# EasyEDA Pro project ProPrj_CraftVia-Core-S-G031-v1-Rev0.epro

# Schematic Core-S-G031-Rev0
Board Name: Board1; Create Date: 2026-09-03; Page Name: P1; Project Name: CraftVia-Core-S-G031-v1-Rev0; Schematic Name: Schematic1; Update Date: 2026-09-03; Company: CraftVia,org; Page Size: A3; Version: V1.0
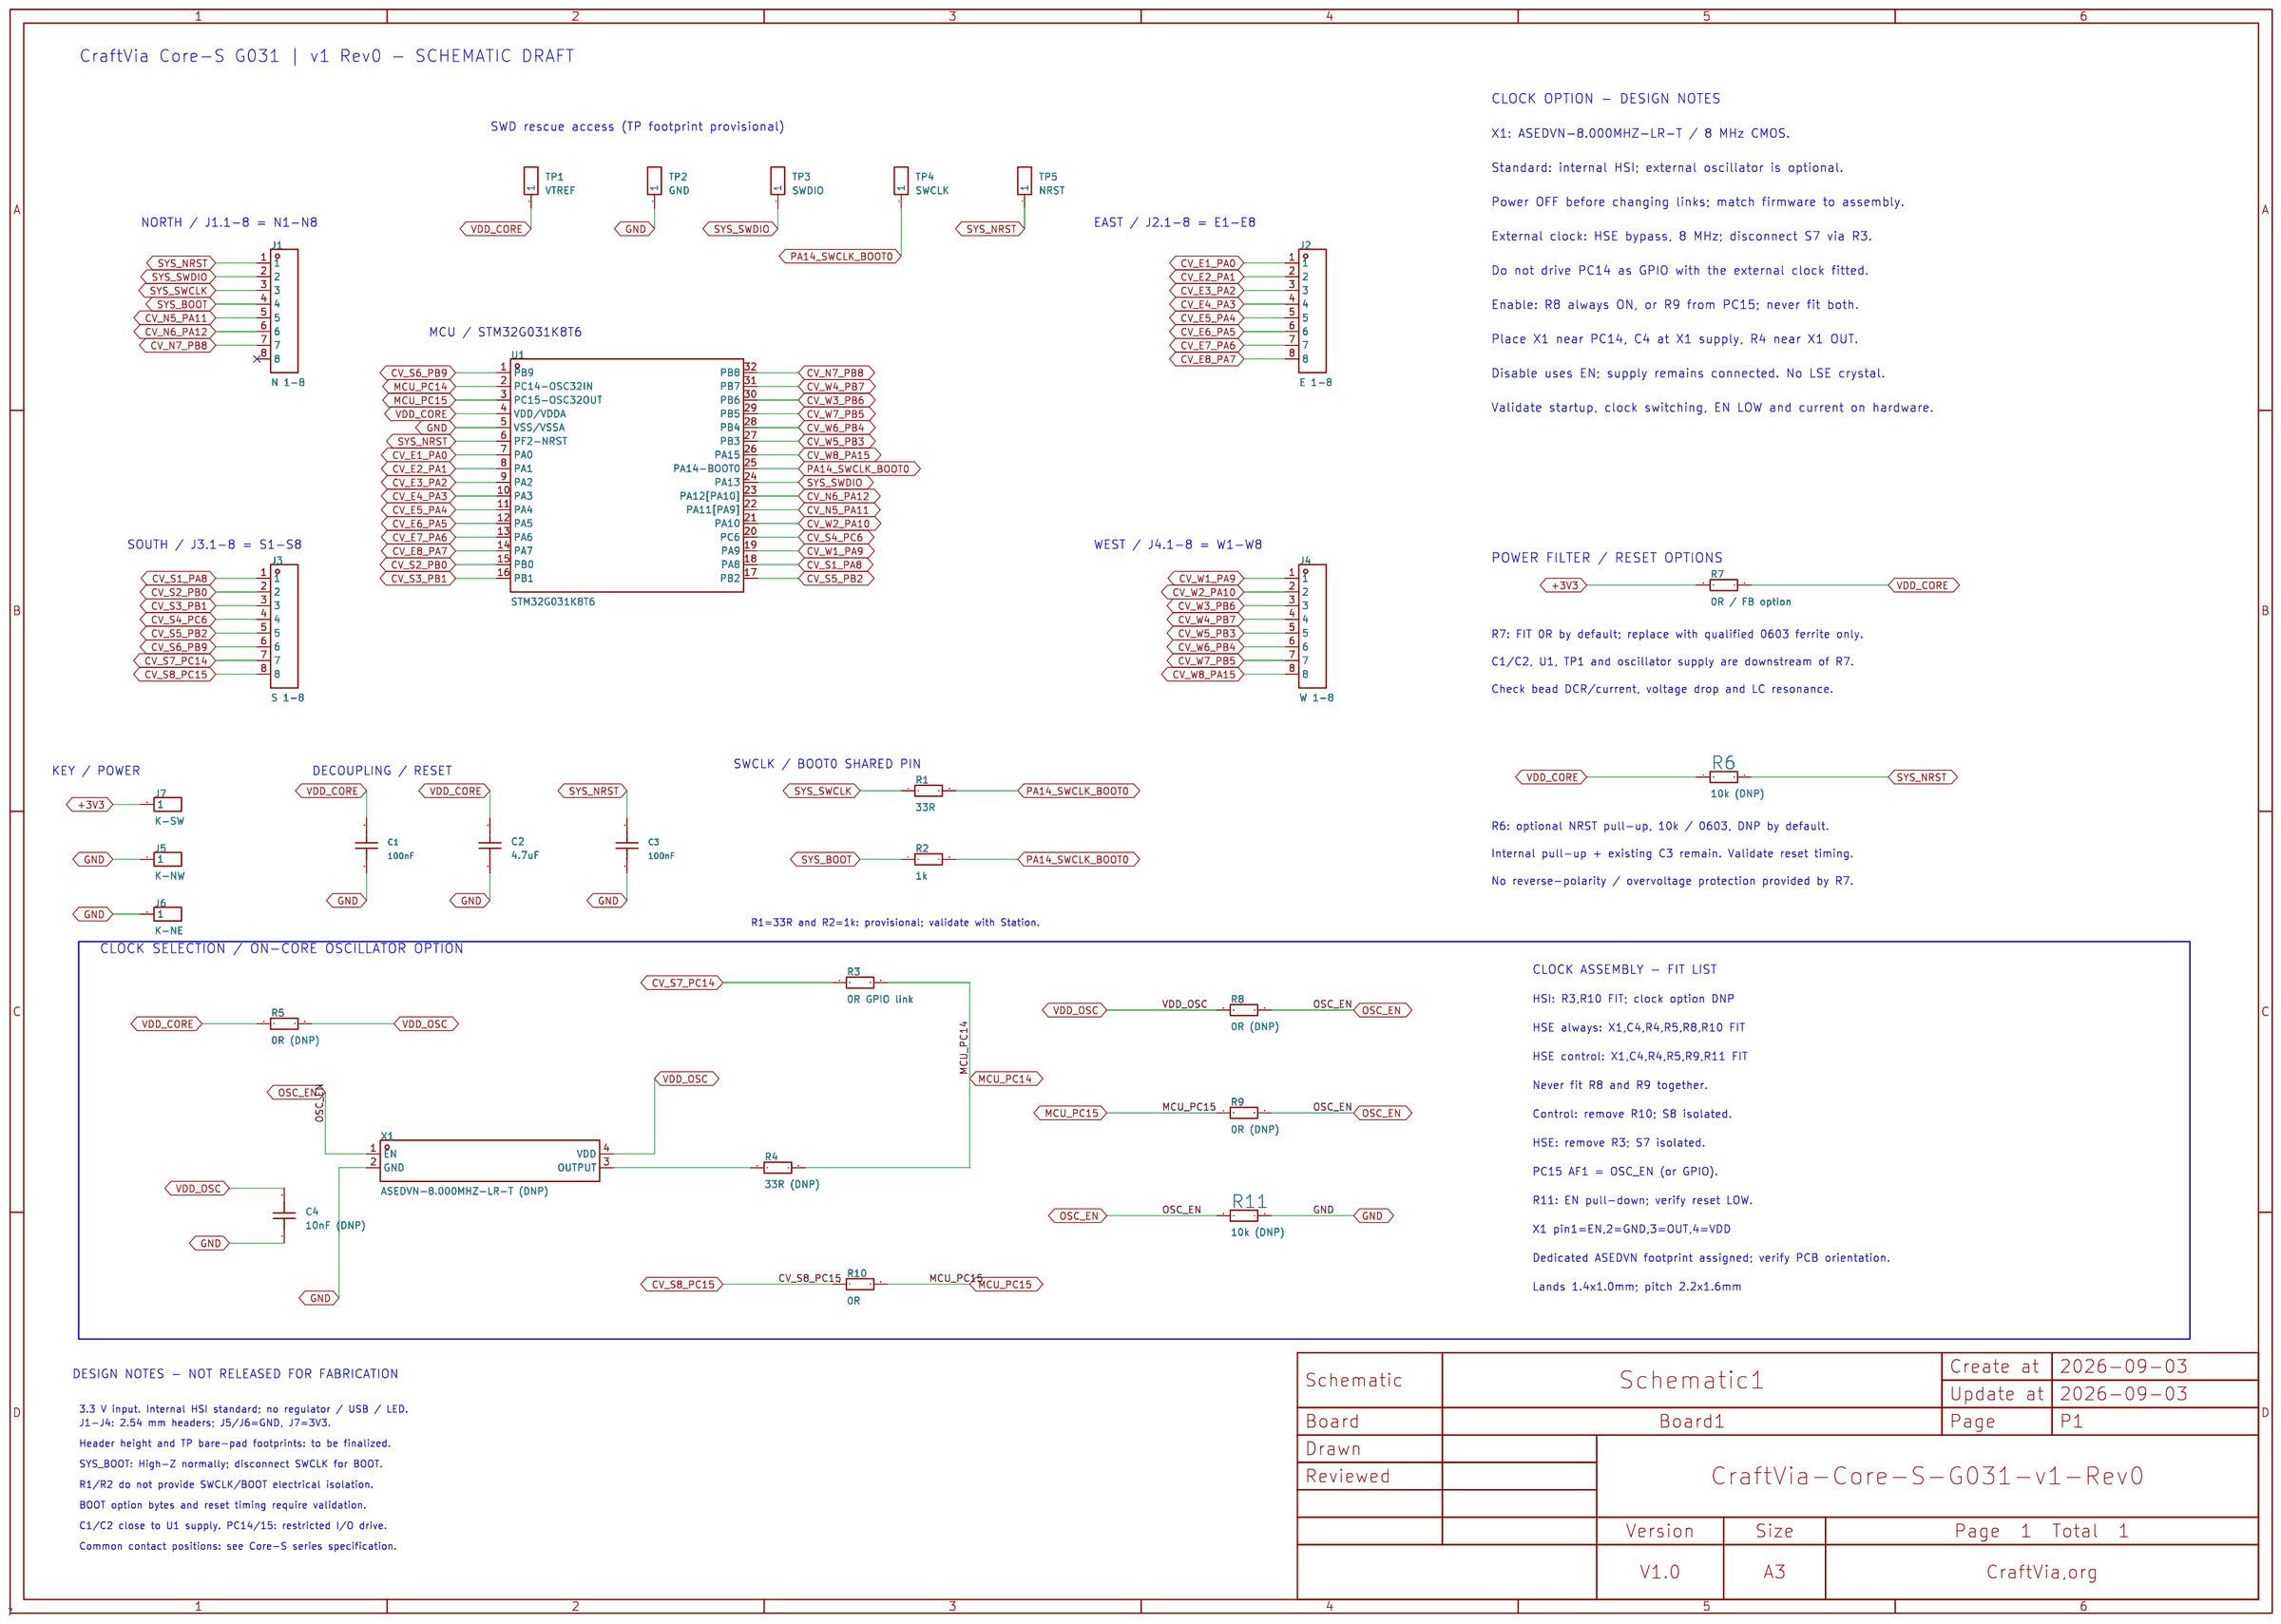
[diagram p0: schematic sheet]

## Parts
C1  100nF  [C0603]
C2  4.7uF  [C0603]
C3  100nF  [C0603]
C4  10nF  [C0603]  (no BOM)
J1  N 1-8  [HDR-TH_8P-P2.54-V-M]
J2  E 1-8  [HDR-TH_8P-P2.54-V-M]
J3  S 1-8  [HDR-TH_8P-P2.54-V-M]
J4  W 1-8  [HDR-TH_8P-P2.54-V-M]
J5  K-NW  [HDR-TH_1P-P2.54-V-M]
J6  K-NE  [HDR-TH_1P-P2.54-V-M]
J7  K-SW  [HDR-TH_1P-P2.54-V-M]
R1  33Ω  [R0603]
R2  1kΩ  [R0603]
R3  0Ω  [R0603]
R4  33Ω  [R0603]  (no BOM)
R5  0Ω  [R0603]  (no BOM)
R6  10kΩ  [R0603]  (no BOM)
R7  0Ω  [R0603]
R8  0Ω  [R0603]  (no BOM)
R9  0Ω  [R0603]  (no BOM)
R10  0Ω  [R0603]
R11  10kΩ  [R0603]  (no BOM)
TP1  VTREF  [HDR-TH_1P-P2.54-V-M]  (no BOM)
TP2  GND  [HDR-TH_1P-P2.54-V-M]  (no BOM)
TP3  SWDIO  [HDR-TH_1P-P2.54-V-M]  (no BOM)
TP4  SWCLK  [HDR-TH_1P-P2.54-V-M]  (no BOM)
TP5  NRST  [HDR-TH_1P-P2.54-V-M]  (no BOM)
U1  STM32G031K8T6  [LQFP-32_L7.0-W7.0-P0.80-LS9.0-BL]
X1  8MHz  [CraftVia_ASEDVN_3225_4P]  (no BOM)

## Library data of the parts
C1 C3 = CC0603KRX7R9BB104: Capacitance:100nF Tolerance:±10% Tolerance:±10% Voltage Rating:50V Temperature Coefficient:X7R; LCSC Part Name: 100nF ±10% 50V; Supplier Part: C14663; Manufacturer: YAGEO(国巨); Supplier Footprint: 0603; JLCPCB Part Class: Basic Part; Datasheet: https://item.szlcsc.com/datasheet/CC0603KRX7R9BB104/15331.html; Supplier: LCSC; Tolerance: ±10%; Voltage Rating: 50V; Temperature Coefficient: X7R
C2 = CL10A475KO8NNNC: Capacitance:4.7uF Tolerance:±10% Tolerance:±10% Voltage Rating:16V Temperature Coefficient:X5R; LCSC Part Name: 4.7uF ±10% 16V; Supplier Part: C19666; Manufacturer: SAMSUNG(三星); Supplier Footprint: 0603; JLCPCB Part Class: Basic Part; Datasheet: https://item.szlcsc.com/datasheet/CL10A475KO8NNNC/20375.html; Supplier: LCSC; Tolerance: ±10%; Voltage Rating: 16V; Temperature Coefficient: X5R
C4 = 0603B103K500NT: Capacitance:10nF Tolerance:±10% Tolerance:±10% Voltage Rating:50V Temperature Coefficient:X7R; LCSC Part Name: 10nF ±10% 50V; Supplier Part: C57112; Manufacturer: FH(风华); Supplier Footprint: 0603; JLCPCB Part Class: Basic Part; Datasheet: https://item.szlcsc.com/datasheet/0603B103K500NT/58143.html; Supplier: LCSC; Tolerance: ±10%; Voltage Rating: 50V; Temperature Coefficient: X7R
J1-J4 = 直排针2.54mm 1*8P: Circluar Pins/Square Pins:- Current Rating (Max):- Voltage Rating (Max):- Length of Mating Pin:- Insulation Height:- Contact Material:; LCSC Part Name: 直排针 2.54mm 1*8P; Supplier Part: C49256; Supplier Footprint: 插件; JLCPCB Part Class: Extended Part; Supplier: LCSC
J5-J7 TP1-TP5 = 2.54-1*1P针: Pin Structure:1x1P Pitch:- Row Spacing:- Circluar Pins/Square Pins:Pin Header Mounting Type:Through Hole Number of Rows:1 Number of Pins:1P Current Rating:3A Voltage Rating (Max):- Length of Mating Pin:6mm Insulation Height:2.5mm Length of End Connection; LCSC Part Name: 1x1P 方针 直插; Supplier Part: C81276; Manufacturer: BOOMELE(博穆精密); Supplier Footprint: 插件,P=2.54mm; JLCPCB Part Class: Extended Part; Datasheet: https://item.szlcsc.com/datasheet/2.54-1*1P%25E9%2592%2588/82426.html; Supplier: LCSC; Pin Structure: 1x1P; Circluar Pins/Square Pins: Pin Header; Mounting Type: Through Hole; Number of Rows: 1; Number of Pins: 1P; Current Rating: 3A; Length of Mating Pin: 6mm; Insulation Height: 2.5mm; Length of End Connection Pin: 3mm; Contact Material: Brass; Contact Plating: Gold; Operating Temperature: -55℃~+105℃; Color: Black
R1 R4 = 0603WAF330JT5E: Type:Thick Film Resistor Resistance:33Ω Tolerance:±1% Tolerance:±1% Power(Watts):100mW Voltage-Supply(Max):75V Temperature Coefficient:±100ppm/℃ Temperature Coefficient:±100ppm/℃ Operating Temperature:-55℃~+155℃ Operating Temperature:-55℃~+155℃; LCSC Part Name: 33Ω ±1% 100mW 厚膜电阻; Supplier Part: C23140; Manufacturer: UNI-ROYAL(厚声); Supplier Footprint: 0603; JLCPCB Part Class: Basic Part; Datasheet: https://item.szlcsc.com/datasheet/0603WAF330JT5E/23867.html; Supplier: LCSC; Type: Thick Film Resistor; Tolerance: ±1%; Power(Watts): 100mW; Voltage-Supply(Max): 75V; Temperature Coefficient: ±100ppm/℃; Operating Temperature: -55℃~+155℃
R2 = 0603WAF1001T5E: Type:Thick Film Resistor Resistance:1kΩ Tolerance:±1% Tolerance:±1% Power(Watts):100mW Voltage-Supply(Max):75V Temperature Coefficient:±100ppm/℃ Temperature Coefficient:±100ppm/℃ Operating Temperature:-55℃~+155℃ Operating Temperature:-55℃~+155℃; LCSC Part Name: 1kΩ ±1% 100mW 厚膜电阻; Supplier Part: C21190; Manufacturer: UNI-ROYAL(厚声); Supplier Footprint: 0603; JLCPCB Part Class: Basic Part; Datasheet: https://item.szlcsc.com/datasheet/0603WAF1001T5E/21904.html; Supplier: LCSC; Type: Thick Film Resistor; Tolerance: ±1%; Power(Watts): 100mW; Voltage-Supply(Max): 75V; Temperature Coefficient: ±100ppm/℃; Operating Temperature: -55℃~+155℃
R3 R5 R7-R10 = 0603WAF0000T5E: Type:Thick Film Resistor Resistance:0Ω Tolerance:±1% Tolerance:±1% Power(Watts):100mW Voltage-Supply(Max):75V Temperature Coefficient:- Temperature Coefficient:- Operating Temperature:-55℃~+155℃ Operating Temperature:-55℃~+155℃; LCSC Part Name: 厚膜电阻 0Ω ±1%; Supplier Part: C21189; Manufacturer: UNI-ROYAL(厚声); Supplier Footprint: 0603; JLCPCB Part Class: Basic Part; Datasheet: https://item.szlcsc.com/datasheet/0603WAF0000T5E/21903.html; Supplier: LCSC; Type: Thick Film Resistor; Tolerance: ±1%; Power(Watts): 100mW; Voltage-Supply(Max): 75V; Operating Temperature: -55℃~+155℃
R6 R11 = 0603WAF1002T5E: Type:Thick Film Resistor Resistance:10kΩ Tolerance:±1% Tolerance:±1% Power(Watts):100mW Voltage-Supply(Max):75V Temperature Coefficient:±100ppm/℃ Temperature Coefficient:±100ppm/℃ Operating Temperature:-55℃~+155℃ Operating Temperature:-55℃~+155℃; LCSC Part Name: 厚膜电阻 10kΩ ±1% 100mW; Supplier Part: C25804; Manufacturer: UNI-ROYAL(厚声); Supplier Footprint: 0603; JLCPCB Part Class: Basic Part; Datasheet: https://item.szlcsc.com/datasheet/0603WAF1002T5E/26547.html; Supplier: LCSC; Type: Thick Film Resistor; Tolerance: ±1%; Power(Watts): 100mW; Voltage-Supply(Max): 75V; Temperature Coefficient: ±100ppm/℃; Operating Temperature: -55℃~+155℃
U1 = STM32G031K8T6: CPU Core:ARM Cortex-M0+ CPU Maximum Speed:64MHz Core Size:32 Bit Program Storage Size:64KB Program Memory Type:FLASH RAM Size:8KB EEPROM:- Number of I/O:30 ADC (Bit):12bit Oscillator Type:Built-in+External Voltage - Supply:1.7V~3.6V Voltage - Supply:1.7V~; LCSC Part Name: 主流Arm Cortex-M0+ MCU，具有64 KB Flash存储器、8 KB RAM、64 MHz CPU、2x USART、定时器、ADC和通信接口，1.7-3.6V; Supplier Part: C432203; Manufacturer: ST(意法半导体); Supplier Footprint: LQFP-32(7x7); JLCPCB Part Class: Extended Part; Datasheet: https://item.szlcsc.com/datasheet/STM32G031K8T6/428991.html; Supplier: LCSC; CPU Core: ARM Cortex-M0+; CPU Maximum Speed: 64MHz; Core Size: 32 Bit; Program Storage Size: 64KB; Program Memory Type: FLASH; RAM Size: 8KB; Number of I/O: 30; ADC (Bit): 12bit; Oscillator Type: Built-in+External; Voltage - Supply: 1.7V~3.6V; Operating Temperature: -40℃~+85℃
X1 = ASEDVN-8.000MHZ-LR-T: Dedicated ASEDVN recommended land: 1.4x1.0mm; pitch 2.2x1.6mm. 1=EN,2=GND,3=OUT,4=VDD. No 3D model.; Manufacturer: Abracon; Supplier: DigiKey; Supplier Part: 535-ASEDVN-8.000MHZ-LR-TCT-ND; Datasheet: https://abracon.com/datasheets/ASEDVN.pdf; Voltage - Supply: 1.6V to 3.63V; Operating Temperature: -40C to +85C; Frequency Stability: 25ppm

## Nets
+3V3: J7.1 R7.1
GND: C1.1 C2.1 C3.1 C4.1 J5.1 J6.1 R11.2 TP2.1 U1.5(VSS/VSSA) X1.2(GND)
VDD_CORE: C1.2 C2.2 R5.1 R6.1 R7.2 TP1.1 U1.4(VDD/VDDA)
VDD_OSC: C4.2 R5.2 R8.1 X1.4(VDD)
CV_E1_PA0: J2.1 U1.7(PA0)
CV_E2_PA1: J2.2 U1.8(PA1)
CV_E3_PA2: J2.3 U1.9(PA2)
CV_E4_PA3: J2.4 U1.10(PA3)
CV_E5_PA4: J2.5 U1.11(PA4)
CV_E6_PA5: J2.6 U1.12(PA5)
CV_E7_PA6: J2.7 U1.13(PA6)
CV_E8_PA7: J2.8 U1.14(PA7)
CV_N5_PA11: J1.5 U1.22(PA11[PA9])
CV_N6_PA12: J1.6 U1.23(PA12[PA10])
CV_N7_PB8: J1.7 U1.32(PB8)
CV_S1_PA8: J3.1 U1.18(PA8)
CV_S2_PB0: J3.2 U1.15(PB0)
CV_S3_PB1: J3.3 U1.16(PB1)
CV_S4_PC6: J3.4 U1.20(PC6)
CV_S5_PB2: J3.5 U1.17(PB2)
CV_S6_PB9: J3.6 U1.1(PB9)
CV_S7_PC14: J3.7 R3.1
CV_S8_PC15: J3.8 R10.1
CV_W1_PA9: J4.1 U1.19(PA9)
CV_W2_PA10: J4.2 U1.21(PA10)
CV_W3_PB6: J4.3 U1.30(PB6)
CV_W4_PB7: J4.4 U1.31(PB7)
CV_W5_PB3: J4.5 U1.27(PB3)
CV_W6_PB4: J4.6 U1.28(PB4)
CV_W7_PB5: J4.7 U1.29(PB5)
CV_W8_PA15: J4.8 U1.26(PA15)
MCU_PC14: R3.2 R4.2 U1.2(PC14-OSC32IN)
MCU_PC15: R9.1 R10.2 U1.3(PC15-OSC32OUT)
OSC_EN: R8.2 R9.2 R11.1 X1.1(EN)
OSC_OUT: R4.1 X1.3(OUTPUT)
PA14_SWCLK_BOOT0: R1.2 R2.2 TP4.1 U1.25(PA14-BOOT0)
SYS_BOOT: J1.4 R2.1
SYS_NRST: C3.2 J1.1 R6.2 TP5.1 U1.6(PF2-NRST)
SYS_SWCLK: J1.3 R1.1
SYS_SWDIO: J1.2 TP3.1 U1.24(PA13)

Not connected (* = marked no-connect by the designer): J1 8*

## Notes on the sheet
- CraftVia Core-S G031 | v1 Rev0 - SCHEMATIC DRAFT
- CLOCK OPTION - DESIGN NOTES
- SWD rescue access (TP footprint provisional)
- X1: ASEDVN-8.000MHZ-LR-T / 8 MHz CMOS.
- Standard: internal HSI; external oscillator is optional.
- Power OFF before changing links; match firmware to assembly.
- NORTH / J1.1-8 = N1-N8
- EAST / J2.1-8 = E1-E8
- External clock: HSE bypass, 8 MHz; disconnect S7 via R3.
- Do not drive PC14 as GPIO with the external clock fitted.
- Enable: R8 always ON, or R9 from PC15; never fit both.
- MCU / STM32G031K8T6
- Place X1 near PC14, C4 at X1 supply, R4 near X1 OUT.
- Disable uses EN; supply remains connected. No LSE crystal.
- Validate startup, clock switching, EN LOW and current on hardware.
- SOUTH / J3.1-8 = S1-S8
- WEST / J4.1-8 = W1-W8
- POWER FILTER / RESET OPTIONS
- R7: FIT 0R by default; replace with qualified 0603 ferrite only.
- C1/C2, U1, TP1 and oscillator supply are downstream of R7.
- Check bead DCR/current, voltage drop and LC resonance.
- KEY / POWER
- DECOUPLING / RESET
- SWCLK / BOOT0 SHARED PIN
- R6: optional NRST pull-up, 10k / 0603, DNP by default.
- Internal pull-up + existing C3 remain. Validate reset timing.
- No reverse-polarity / overvoltage protection provided by R7.
- R1=33R and R2=1k: provisional; validate with Station.
- CLOCK SELECTION / ON-CORE OSCILLATOR OPTION
- CLOCK ASSEMBLY - FIT LIST
- HSI: R3,R10 FIT; clock option DNP
- HSE always: X1,C4,R4,R5,R8,R10 FIT
- HSE control: X1,C4,R4,R5,R9,R11 FIT
- Never fit R8 and R9 together.
- Control: remove R10; S8 isolated.
- HSE: remove R3; S7 isolated.
- PC15 AF1 = OSC_EN (or GPIO).
- R11: EN pull-down; verify reset LOW.
- X1 pin1=EN,2=GND,3=OUT,4=VDD
- Dedicated ASEDVN footprint assigned; verify PCB orientation.
- Lands 1.4x1.0mm; pitch 2.2x1.6mm
- DESIGN NOTES - NOT RELEASED FOR FABRICATION
- 3.3 V input. Internal HSI standard; no regulator / USB / LED.
- J1-J4: 2.54 mm headers; J5/J6=GND, J7=3V3.
- Header height and TP bare-pad footprints: to be finalized.
- SYS_BOOT: High-Z normally; disconnect SWCLK for BOOT.
- R1/R2 do not provide SWCLK/BOOT electrical isolation.
- BOOT option bytes and reset timing require validation.
- C1/C2 close to U1 supply. PC14/15: restricted I/O drive.
- Common contact positions: see Core-S series specification.

# Board PCB1
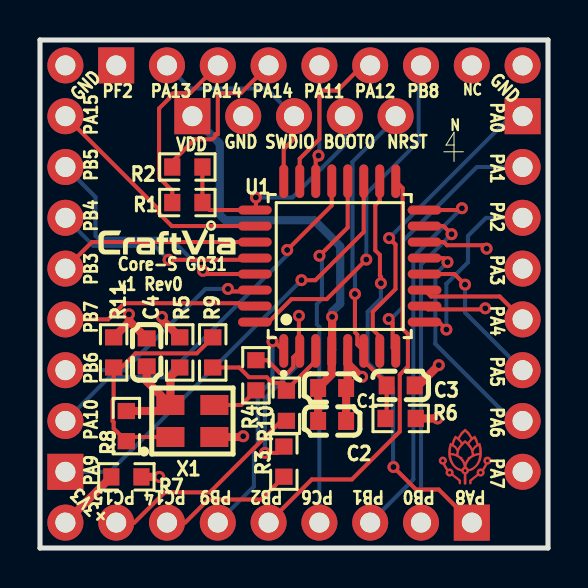
[diagram p1: board, top side]
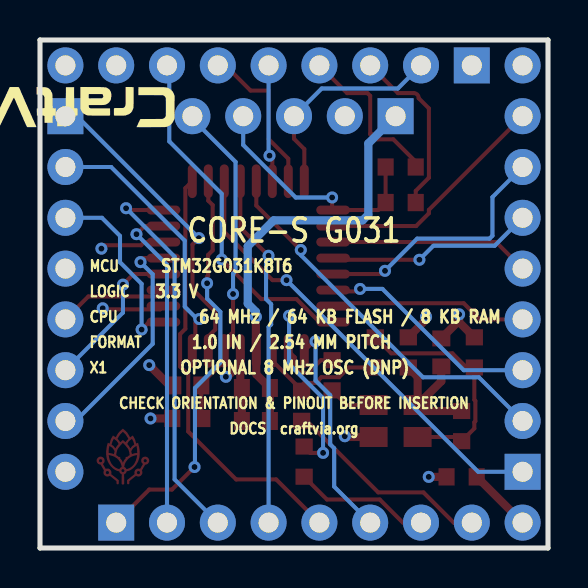
[diagram p2: board, bottom side, seen from below]

Outline 25.4 x 25.4 mm; copper layers: Top Layer, GND Plane, Power / Signal, Bottom Layer. Coordinates in mm from the lower left corner of the outline.
Outline path: 0,25.4 0,0 25.4,0 25.4,25.4 0,25.4
Stack: Top Layer 0.035mm Outer layer thickness 1oz / Dielectric1 0.2104mm 7628 RC49% 8.6mil / GND Plane 0.035mm / Dielectric2 1.065mm 1.1mm H/HOZ Copper / Power / Signal 0.035mm / Dielectric3 0.2104mm 7628 RC49% 8.6mil / Bottom Layer 0.035mm Outer layer thickness 1oz

## Design rules (mm)
spacing copperThickness1oz (default): track to track 0.152, other pairs 0.152 to 0.3
spacing copperThickness2oz: track to track 0.203, other pairs 0.152 to 0.3
track width copperThickness1oz (default): min 0.152, default 0.203, max 2.54
track width copperThickness2oz: min 0.203, default 0.254, max 2.54
track width powerTrack: min 0.254, default 0.406, max 2.54
differential pair differentialPair (default): width min 0.127, default 0.254, max 2.54; gap min 0.152, default 0.152
net VDD_CORE uses copperRegion, powerTrack
net GND uses copperRegion, powerTrack
net VDD_OSC uses powerTrack
net +3V3 uses powerTrack

## Placement (name value [footprint] x y rotation side)
C1  100nF  [C0603]  14.6 8 180 top
C2  4.7uF  [C0603]  14.6 6.35 180 top
C3  100nF  [C0603]  18.03 8.13 180 top
C4  10nF  [C0603]  5.33 9.78 270 top
J1  N 1-8  [HDR-TH_8P-P2.54-V-M]  12.7 24.13 0 top
J2  E 1-8  [HDR-TH_8P-P2.54-V-M]  24.13 12.7 270 top
J3  S 1-8  [HDR-TH_8P-P2.54-V-M]  12.7 1.27 180 top
J4  W 1-8  [HDR-TH_8P-P2.54-V-M]  1.27 12.7 90 top
J5  K-NW  [HDR-TH_1P-P2.54-V-M]  1.27 24.13 0 top
J6  K-NE  [HDR-TH_1P-P2.54-V-M]  24.13 24.13 0 top
J7  K-SW  [HDR-TH_1P-P2.54-V-M]  1.27 1.27 0 top
R1  33Ω  [R0603]  7.37 17.27 0 top
R2  1kΩ  [R0603]  7.37 19.05 0 top
R3  0Ω  [R0603]  12.19 4.32 90 top
R4  33Ω  [R0603]  10.79 8.64 90 top
R5  0Ω  [R0603]  6.99 9.78 270 top
R6  10kΩ  [R0603]  18.03 6.48 180 top
R7  0Ω  [R0603]  4.32 3.56 0 top
R8  0Ω  [R0603]  4.32 6.1 270 top
R9  0Ω  [R0603]  8.64 9.78 90 top
R10  0Ω  [R0603]  12.32 7.11 90 top
R11  10kΩ  [R0603]  3.68 9.78 90 top
TP1  VTREF  [HDR-TH_1P-P2.54-V-M#2]  7.62 21.59 0 top
TP2  GND  [HDR-TH_1P-P2.54-V-M]  10.16 21.59 0 top
TP3  SWDIO  [HDR-TH_1P-P2.54-V-M]  12.7 21.59 0 top
TP4  SWCLK  [HDR-TH_1P-P2.54-V-M]  15.24 21.59 0 top
TP5  NRST  [HDR-TH_1P-P2.54-V-M]  17.78 21.59 0 top
U1  STM32G031K8T6  [LQFP-32_L7.0-W7.0-P0.80-LS9.0-BL]  14.99 14.1 0 top
X1  8MHz  [CraftVia_ASEDVN_3225_4P]  7.62 6.35 0 top

## Footprints (pads in the part's own frame, mm; a bottom-side part is the same pattern mirrored in y, then rotated)
C0603
  rect 0.8x0.9 smd: 1(-0.7,0) 2(0.7,0)
CraftVia_ASEDVN_3225_4P
  rect 1.4x1 smd: 1(-1.1,-0.8) 2(1.1,-0.8) 3(1.1,0.8) 4(-1.1,0.8)
HDR-TH_1P-P2.54-V-M
  round 1.801 hole 1.001: 1(0,0)
HDR-TH_1P-P2.54-V-M#2
  rect 1.801x1.801 hole 1: 1(0,0)
HDR-TH_8P-P2.54-V-M
  rect 1.8x1.8 hole 1: 1(-8.89,0)
  round 1.8 hole 1: 2(-6.35,0) 3(-3.81,0) 4(-1.27,0) 5(1.27,0) 6(3.81,0) 7(6.35,0) 8(8.89,0)
LQFP-32_L7.0-W7.0-P0.80-LS9.0-BL
  oval 0.448x1.684 smd: 1(-2.8,-4.242) 2(-2,-4.242) 3(-1.2,-4.242) 4(-0.4,-4.242) 5(0.4,-4.242) 6(1.2,-4.242) 7(2,-4.242) 8(2.8,-4.242) 17(2.8,4.242) 18(2,4.242) 19(1.2,4.242) 20(0.4,4.242) 21(-0.4,4.242) 22(-1.2,4.242) 23(-2,4.242) 24(-2.8,4.242)
  oval 1.684x0.448 smd: 9(4.242,-2.8) 10(4.242,-2) 11(4.242,-1.2) 12(4.242,-0.4) 13(4.242,0.4) 14(4.242,1.2) 15(4.242,2) 16(4.242,2.8) 25(-4.242,2.8) 26(-4.242,2) 27(-4.242,1.2) 28(-4.242,0.4) 29(-4.242,-0.4) 30(-4.242,-1.2) 31(-4.242,-2) 32(-4.242,-2.8)
R0603
  rect 0.806x0.864 smd: 1(-0.753,0) 2(0.753,0)

## Nets
As in the schematic.

Pads without a net: J1 8

## Via types
v1: diameter 0.6, hole 0.3, Top Layer to Bottom Layer, 32 vias

## Routing (per net, layer and track width the routed paths; a pad name or vN(x,y) marks a point on that pad's centre or on a via; arc(x,y) is an arc through that point)
+3V3: length 3.2
  Top Layer w0.406: R7.1 3.56,3.56 J7.1
GND: length 10.3
  Top Layer w0.406: 15.39,9.22 15.39,9.86 ; 15.39,9.22 16.04,8.56 v1(16.11,8.56) ; 15.39,9.22 15.39,8.08 C1.1 C2.1 ; X1.2 10.12,5.55 v1(10.16,5.59) ; 4.44,11.29 v1(4.44,11.68) ; 4.44,11.29 R11.2 ; 4.44,11.29 4.52,11.29 C4.1 ; v1(19.94,9.14) 18.92,8.13 C3.1
VDD_CORE: length 24.7
  Top Layer w0.406: R6.1 v1(19.87,6.48) ; R5.1 6.1,11.42 v1(6.1,11.56) ; C2.2 C1.2 14.59,8.68 14.59,9.86 arc(14.6,9.86) 14.6,9.87 v1(14.6,11.56) ; R7.2 v1(5.96,3.56)
  Bottom Layer w0.406: v1(14.6,11.56) 14.6,11.81 15.01,12.22 15.01,15.09 13.72,16.38 9.27,16.38 8.98,16.67 8.98,20.23 TP1.1
VDD_OSC: length 6.8
  Top Layer w0.406: R5.2 6.52,8.56 X1.4 ; X1.4 5.33,8.34 C4.2 ; X1.4 6.22,6.85 R8.1
CV_E1_PA0: length 15.6
  Top Layer w0.203: v1(17.46,15.49) 17.78,15.17 17.78,12.95 16.64,11.81 16.64,10.92 16.99,10.57 16.99,9.86
  Bottom Layer w0.203: J2.1 23.55,21.59 v1(17.46,15.49)
CV_E2_PA1: length 13.5
  Top Layer w0.203: 17.79,9.86 17.63,10.01 17.63,11.25 v1(17.44,11.45)
  Bottom Layer w0.203: v1(17.44,11.45) 17.54,11.45 18.16,12.06 18.16,15.37 21.84,19.05 J2.2
CV_E3_PA2: length 9.5
  Top Layer w0.203: U1.9 19.94,11.3 v1(20.32,10.92)
  Bottom Layer w0.203: v1(20.32,10.92) 20.32,13.21 21.4,14.29 21.4,15.6 22.31,16.51 J2.3
CV_E4_PA3: length 5.9
  Top Layer w0.203: v1(22.26,11.98) 22.21,11.93 19.39,11.93 U1.10
  Power / Signal w0.203: v1(22.26,11.98) 22.26,12.11 J2.4
CV_E5_PA4: length 5.5
  Top Layer w0.203: U1.11 19.55,12.58 22.99,12.58 J2.5
CV_E6_PA5: length 7.7
  Top Layer w0.203: v1(21.25,13.17) 20.72,13.7 U1.12
  Bottom Layer w0.203: J2.6 21.25,11.77 v1(21.25,13.17)
CV_E7_PA6: length 11.5
  Top Layer w0.203: U1.13 20.17,14.5 v1(20.37,14.29)
  Bottom Layer w0.203: v1(20.37,14.29) 19.77,13.69 19.77,10.21 23.62,6.35 J2.7
CV_E8_PA7: length 16.2
  Top Layer w0.203: U1.14 20.19,15.3 20.35,15.14 22.16,15.14 v1(22.33,14.97)
  Power / Signal w0.203: v1(22.33,14.97) 22.33,12.93 21.08,11.68 21.08,7.77 24.13,4.72 J2.8
CV_N5_PA11: length 5.9
  Top Layer w0.203: U1.22 13.79,19.48 arc(13.83,19.58) v1(13.92,19.62)
  Bottom Layer w0.203: J1.5 13.97,19.66 arc(13.96,19.63) v1(13.92,19.62)
CV_N6_PA12: length 8
  Top Layer w0.203: U1.23 12.99,19.46 13.97,20.45 13.97,22.87 14.87,22.87 16.13,24.13 J1.6
CV_N7_PB8: length 17.7
  Top Layer w0.203: v1(16.31,14.42) 14.34,12.45 12.57,12.45 11.42,11.3 U1.32
  Bottom Layer w0.203: J1.7 18.93,24.01 18.93,20.33 16.31,17.71 v1(16.31,14.42)
CV_S1_PA8: length 20.4
  Top Layer w0.203: 17.03,18.3 U1.18 16.99,17.37 16.76,17.14 16.76,14.88 17,14.65 17,13.61 17.04,13.56 v1(17.04,13.24) ; J3.1 19.94,2.92 18.8,2.92 v1(17.67,4.05)
  Bottom Layer w0.203: v1(17.04,13.24) 17.04,12.47 16.38,11.81 16.38,9.27 17.65,8 17.65,4.07 v1(17.67,4.05)
CV_S2_PB0: length 16.6
  Top Layer w0.203: U1.15 20.17,16.1 v1(20.58,15.69)
  Bottom Layer w0.203: v1(20.58,15.69) 19.05,14.16 J3.2
CV_S3_PB1: length 20.3
  Top Layer w0.203: 18.49,16.9 U1.16 21,16.9 v1(21.1,16.99)
  Bottom Layer w0.203: v1(21.1,16.99) 21.09,16.99 18.67,14.57 18.67,3.43 J3.3
CV_S4_PC6: length 17.9
  Top Layer w0.203: U1.20 15.39,16.02 v1(13.97,14.61)
  Bottom Layer w0.203: J3.4 13.97,11.05 13.84,11.18 13.84,12.19 14.1,12.45 14.1,14.49 v1(13.97,14.61)
CV_S5_PB2: length 21.4
  Top Layer w0.203: J3.5 13.59,3.43 15.59,3.43 17.99,5.82 17.99,8.67 18.4,9.07 18.4,10.7 18.13,10.96 18.13,17.99 U1.17
CV_S6_PB9: length 11
  Top Layer w0.203: 12.19,9.86 11.71,10.33 v1(11.62,10.33)
  Bottom Layer w0.203: v1(11.62,10.33) 11.62,8.37 10.89,7.64 10.89,5.18 10.69,4.99 10.69,3.07 J3.6
CV_S7_PC14: length 6.8
  Top Layer w0.203: J3.7 7.26,1.27 8.41,2.42 11.05,2.42 R3.1
CV_S8_PC15: length 10.7
  Top Layer w0.203: 12.32,6.61 8.49,2.78 6.23,2.78 4.72,1.27 J3.8
CV_W1_PA9: length 22.4
  Top Layer w0.203: U1.19 16.19,15.81 13.77,13.39 v1(13.07,13.39)
  Bottom Layer w0.203: J4.1 3.49,3.81 v1(13.07,13.39)
CV_W2_PA10: length 19.1
  Top Layer w0.203: v1(12.36,14.9) 14.59,17.13 U1.21
  Bottom Layer w0.203: J4.2 3.45,8.53 6.25,8.53 12.36,14.65 v1(12.36,14.9)
CV_W3_PB6: length 11.2
  Top Layer w0.203: U1.30 10.67,12.83 9.53,12.83 v1(9.4,12.95)
  Bottom Layer w0.203: J4.3 4.21,8.89 8.28,12.95 v1(9.4,12.95)
CV_W4_PB7: length 9.9
  Top Layer w0.203: U1.31 10.1,12.1 9.96,12.24 4.22,12.24 3.41,11.43 J4.4
CV_W5_PB3: length 10
  Top Layer w0.203: J4.5 2.6,15.3 U1.27
CV_W6_PB4: length 10.4
  Top Layer w0.203: v1(6.43,14.41) 10.66,14.41 U1.28
  Bottom Layer w0.203: J4.6 2.67,15.11 5.73,15.11 v1(6.43,14.41)
CV_W7_PB5: length 12.8
  Top Layer w0.203: U1.29 8.31,13.7 v1(8.15,13.86)
  Bottom Layer w0.203: v1(8.15,13.86) 6.54,15.47 2.92,15.47 2.78,15.61 2.78,17.54 J4.7
CV_W8_PA15: length 11.8
  Top Layer w0.203: U1.26 6.59,16.1 5.96,16.73 5.96,16.9 J4.8
MCU_PC14: length 13.6
  Top Layer w0.203: R3.2 11.88,4.76 v1(11.25,4.76) ; R4.2 11.36,9.39 11.99,8.76 12.38,8.76 12.66,9.04 12.66,9.53 12.99,9.86 12.95,9.89 v1(12.95,11.61)
  Bottom Layer w0.203: v1(11.25,4.76) 11.25,7.49 12.95,9.19 v1(12.95,11.61)
MCU_PC15: length 6.6
  Top Layer w0.203: 13.79,9.86 13.79,9.36 12.54,8.12 12.32,8.12 12.18,8.25 11.48,8.25 11.48,8.39 11.33,8.54 10.45,8.54 9.96,9.03 R9.1
OSC_EN: length 11.9
  Top Layer w0.203: R9.2 7.84,9.73 4.78,9.73 4.07,9.03 R11.1 3.68,7.41 3.63,7.36 3.63,6.34 3.68,6.29 3.68,5.98 R8.2 4.53,5.55 X1.1
OSC_OUT: length 2.4
  Top Layer w0.203: X1.3 10.06,7.15 R4.1
PA14_SWCLK_BOOT0: length 12.2
  Top Layer w0.203: R2.2 R1.2 8.49,16.9 U1.25 10.79,16.95 v1(10.79,17.53)
  Bottom Layer w0.203: TP4.1 15.24,20.15 12.62,17.53 v1(10.79,17.53)
SYS_BOOT: length 8.2
  Top Layer w0.203: J1.4 10.04,22.74 9.03,22.74 8.89,22.61 8.89,20.69 8.77,20.69 arc(8.7,20.51) 8.52,20.44 7.74,20.44 6.61,19.31 R2.1
SYS_NRST: length 31.8
  Top Layer w0.203: R6.2 17.33,6.53 C3.2 17.33,8.21 16.19,9.36 16.19,9.86 15.86,10.18 15.86,10.67 15.75,10.79 v1(15.75,12.7)
  Power / Signal w0.203: TP5.1 16.51,22.86 5.08,22.86 J1.1
  Bottom Layer w0.203: v1(15.75,12.7) 15.75,13.72 15.62,13.84 15.62,19.3 17.78,21.46 TP5.1
SYS_SWCLK: length 8.8
  Top Layer w0.203: R1.1 6.61,17.86 5.96,18.51 5.96,21.98 6.47,22.49 arc(6.54,22.67) 6.72,22.74 7.5,22.74 J1.3
SYS_SWDIO: length 10.9
  Top Layer w0.203: TP3.1 12.7,20.46 12.19,19.95 U1.24
  Bottom Layer w0.203: J1.2 7.5,22.98 11.31,22.98 TP3.1

## Copper pours and planes (outline as drawn; the poured copper is in the pictures)
GND on GND Plane: 0.41,24.99 24.99,24.99 24.99,0.41 0.41,0.41
VDD_CORE on Power / Signal: 24.99,24.99 24.99,0.41 0.51,0.41 0.51,11.09 0.51,11.65 0.63,12.19 0.67,12.22 0.66,12.26 0.41,24.99

Small or netless copper shapes (teardrops, artwork), in the pictures only: 3 on Top Layer

## Text on the board
Bottom Silkscreen Layer: MCU | LOGIC | CPU | FORMAT | X1 | CHECK ORIENTATION & PINOUT BEFORE INSERTION | DOCS  craftvia.org | 64 MHz / 64 KB FLASH / 8 KB RAM | OPTIONAL 8 MHz OSC (DNP) | 1.0 IN / 2.54 MM PITCH | STM32G031K8T6 | 3.3 V | CORE-S G031
Top Silkscreen Layer: N | NC | Core-S G031 / v1 Rev0 | PA13 | VDD | PA14 | GND | SWDIO | PA11 | BOOT0 | PA12 | NRST | PB8 | PA15 | PB5 | PB4 | PB3 | PB7 | PB6 | PA10 | PA9 | +3V3 | PC15 | PC14 | PB9 | PB2 | PC6 | PB1 | PB0 | PA8 | PA0 | PA1 | PA2 | PA3 | PA4 | PA5 | PA6 | PA7 | PF2
